# Altium project SENSOR.PrjPcb
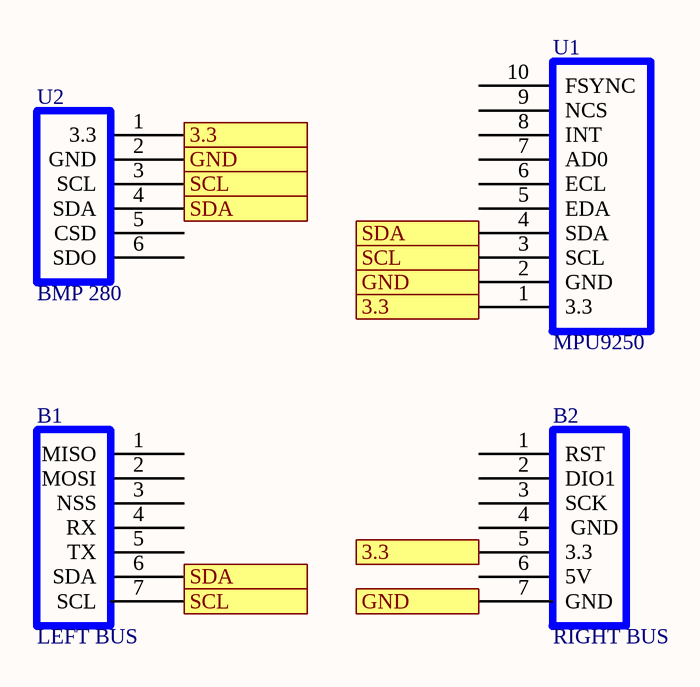
[diagram p0: Sheet2.SchDoc]
1 sheet, 4 parts. Net scope: flat (ports and power ports of the same name join across sheets).
Board file: PCB2.PcbDoc

## Sheet Sheet2.SchDoc
size A4

### Parts
B1  LEFT BUS  [bus right]
B2  RIGHT BUS  [bus left]
U1  MPU9250  [MPU 9250]
U2  BMP 280  [BMP 280]

### Ports
3.3, GND, SCL, SDA

### Nets
NetB1_6: B1.6(SDA) U1.4(SDA) U2.4(SDA) ; port SDA
NetB1_7: B1.7(SCL) U1.3(SCL) U2.3(SCL) ; port SCL
NetB2_5: B2.5(3.3) U1.1(3.3) U2.1(3.3) ; port 3.3
NetB2_7: B2.7(GND) U1.2(GND) U2.2(GND) ; port GND

Not connected (* = marked no-connect by the designer): B1 1(MISO) 2(MOSI) 3(NSS) 4(RX) 5(TX); B2 1(RST) 2(DIO1) 3(SCK) 4(_GND) 6(5V); U1 5(EDA) 6(ECL) 7(AD0) 8(INT) 9(NCS) 10(FSYNC); U2 5(CSD) 6(SDO)

### Library data of the parts
B1 = BUS left
B2 = BUS right